# Altium schematic sheet Top-Sheet.SchDoc
size 420 x 297 mm; SheetNumber: 1; SheetTotal: 10
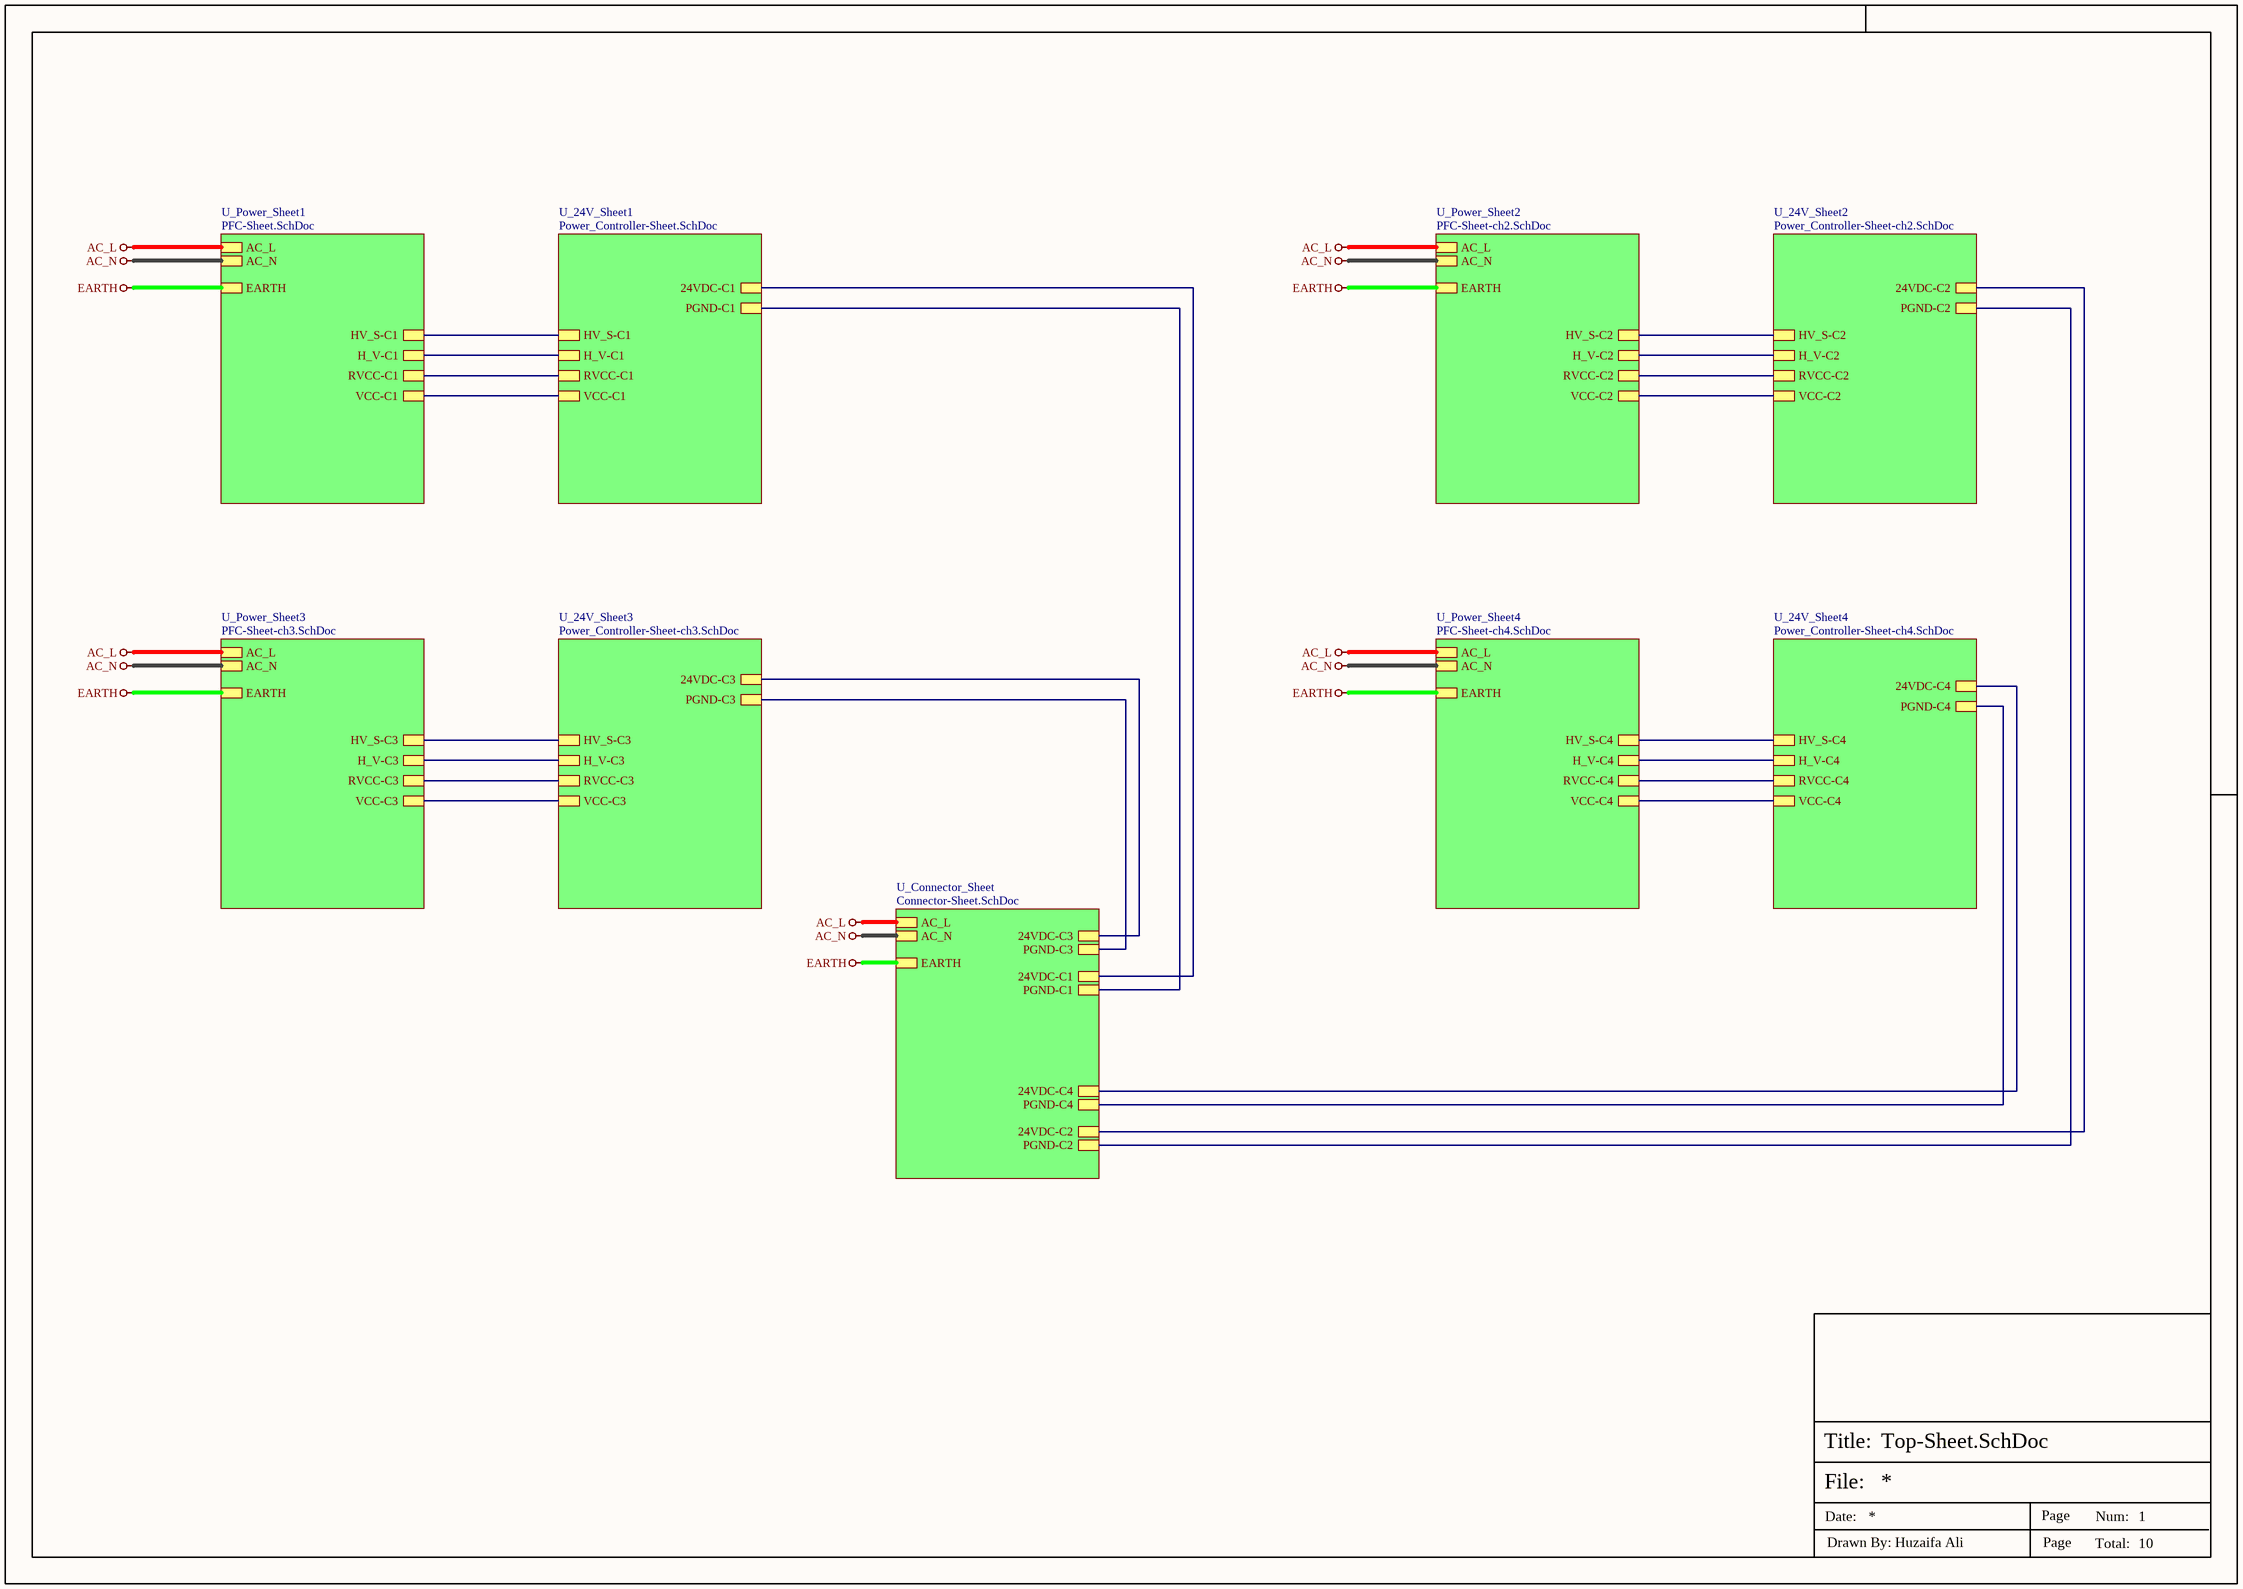
[diagram p0: Top-Sheet.SchDoc]

## Sub-sheets
U_24V_Sheet1 = Power_Controller-Sheet.SchDoc: 24VDC-C1, PGND-C1, HV_S-C1, H_V-C1, RVCC-C1, VCC-C1
U_24V_Sheet2 = Power_Controller-Sheet-ch2.SchDoc: 24VDC-C2, PGND-C2, HV_S-C2, H_V-C2, RVCC-C2, VCC-C2
U_24V_Sheet3 = Power_Controller-Sheet-ch3.SchDoc: 24VDC-C3, PGND-C3, HV_S-C3, H_V-C3, RVCC-C3, VCC-C3
U_24V_Sheet4 = Power_Controller-Sheet-ch4.SchDoc: 24VDC-C4, PGND-C4, HV_S-C4, H_V-C4, RVCC-C4, VCC-C4
U_Connector_Sheet = Connector-Sheet.SchDoc: AC_L, EARTH, AC_N, 24VDC-C1, PGND-C1, 24VDC-C2, PGND-C2, 24VDC-C3, PGND-C3, 24VDC-C4, PGND-C4
U_Power_Sheet1 = PFC-Sheet.SchDoc: AC_L, EARTH, AC_N, HV_S-C1, H_V-C1, RVCC-C1, VCC-C1
U_Power_Sheet2 = PFC-Sheet-ch2.SchDoc: AC_L, EARTH, AC_N, HV_S-C2, H_V-C2, RVCC-C2, VCC-C2
U_Power_Sheet3 = PFC-Sheet-ch3.SchDoc: AC_L, EARTH, AC_N, HV_S-C3, H_V-C3, RVCC-C3, VCC-C3
U_Power_Sheet4 = PFC-Sheet-ch4.SchDoc: AC_L, EARTH, AC_N, HV_S-C4, H_V-C4, RVCC-C4, VCC-C4

## Nets
AC_L: sheet U_Connector_Sheet/AC_L, sheet U_Power_Sheet1/AC_L, sheet U_Power_Sheet2/AC_L, sheet U_Power_Sheet3/AC_L, sheet U_Power_Sheet4/AC_L
AC_N: sheet U_Connector_Sheet/AC_N, sheet U_Power_Sheet1/AC_N, sheet U_Power_Sheet2/AC_N, sheet U_Power_Sheet3/AC_N, sheet U_Power_Sheet4/AC_N
EARTH: sheet U_Connector_Sheet/EARTH, sheet U_Power_Sheet1/EARTH, sheet U_Power_Sheet2/EARTH, sheet U_Power_Sheet3/EARTH, sheet U_Power_Sheet4/EARTH
(unnamed): sheet U_24V_Sheet1/24VDC-C1, sheet U_Connector_Sheet/24VDC-C1
(unnamed): sheet U_24V_Sheet1/PGND-C1, sheet U_Connector_Sheet/PGND-C1
(unnamed): sheet U_24V_Sheet1/HV_S-C1, sheet U_Power_Sheet1/HV_S-C1
(unnamed): sheet U_24V_Sheet1/H_V-C1, sheet U_Power_Sheet1/H_V-C1
(unnamed): sheet U_24V_Sheet1/RVCC-C1, sheet U_Power_Sheet1/RVCC-C1
(unnamed): sheet U_24V_Sheet1/VCC-C1, sheet U_Power_Sheet1/VCC-C1
(unnamed): sheet U_Connector_Sheet/24VDC-C2, sheet U_24V_Sheet2/24VDC-C2
(unnamed): sheet U_Connector_Sheet/PGND-C2, sheet U_24V_Sheet2/PGND-C2
(unnamed): sheet U_Connector_Sheet/24VDC-C3, sheet U_24V_Sheet3/24VDC-C3
(unnamed): sheet U_Connector_Sheet/PGND-C3, sheet U_24V_Sheet3/PGND-C3
(unnamed): sheet U_Connector_Sheet/24VDC-C4, sheet U_24V_Sheet4/24VDC-C4
(unnamed): sheet U_Connector_Sheet/PGND-C4, sheet U_24V_Sheet4/PGND-C4
(unnamed): sheet U_24V_Sheet2/HV_S-C2, sheet U_Power_Sheet2/HV_S-C2
(unnamed): sheet U_24V_Sheet2/H_V-C2, sheet U_Power_Sheet2/H_V-C2
(unnamed): sheet U_24V_Sheet2/RVCC-C2, sheet U_Power_Sheet2/RVCC-C2
(unnamed): sheet U_24V_Sheet2/VCC-C2, sheet U_Power_Sheet2/VCC-C2
(unnamed): sheet U_24V_Sheet3/HV_S-C3, sheet U_Power_Sheet3/HV_S-C3
(unnamed): sheet U_24V_Sheet3/H_V-C3, sheet U_Power_Sheet3/H_V-C3
(unnamed): sheet U_24V_Sheet3/RVCC-C3, sheet U_Power_Sheet3/RVCC-C3
(unnamed): sheet U_24V_Sheet3/VCC-C3, sheet U_Power_Sheet3/VCC-C3
(unnamed): sheet U_24V_Sheet4/HV_S-C4, sheet U_Power_Sheet4/HV_S-C4
(unnamed): sheet U_24V_Sheet4/H_V-C4, sheet U_Power_Sheet4/H_V-C4
(unnamed): sheet U_24V_Sheet4/RVCC-C4, sheet U_Power_Sheet4/RVCC-C4
(unnamed): sheet U_24V_Sheet4/VCC-C4, sheet U_Power_Sheet4/VCC-C4

## Notes on the sheet
- File:
- Title:
- Date:
- Page
- Num:
- Total:
- Drawn By: Huzaifa Ali